# Altium schematic sheet FullAdder_PCB_Project.SchDoc
size A; SheetNumber: 1; SheetTotal: 1
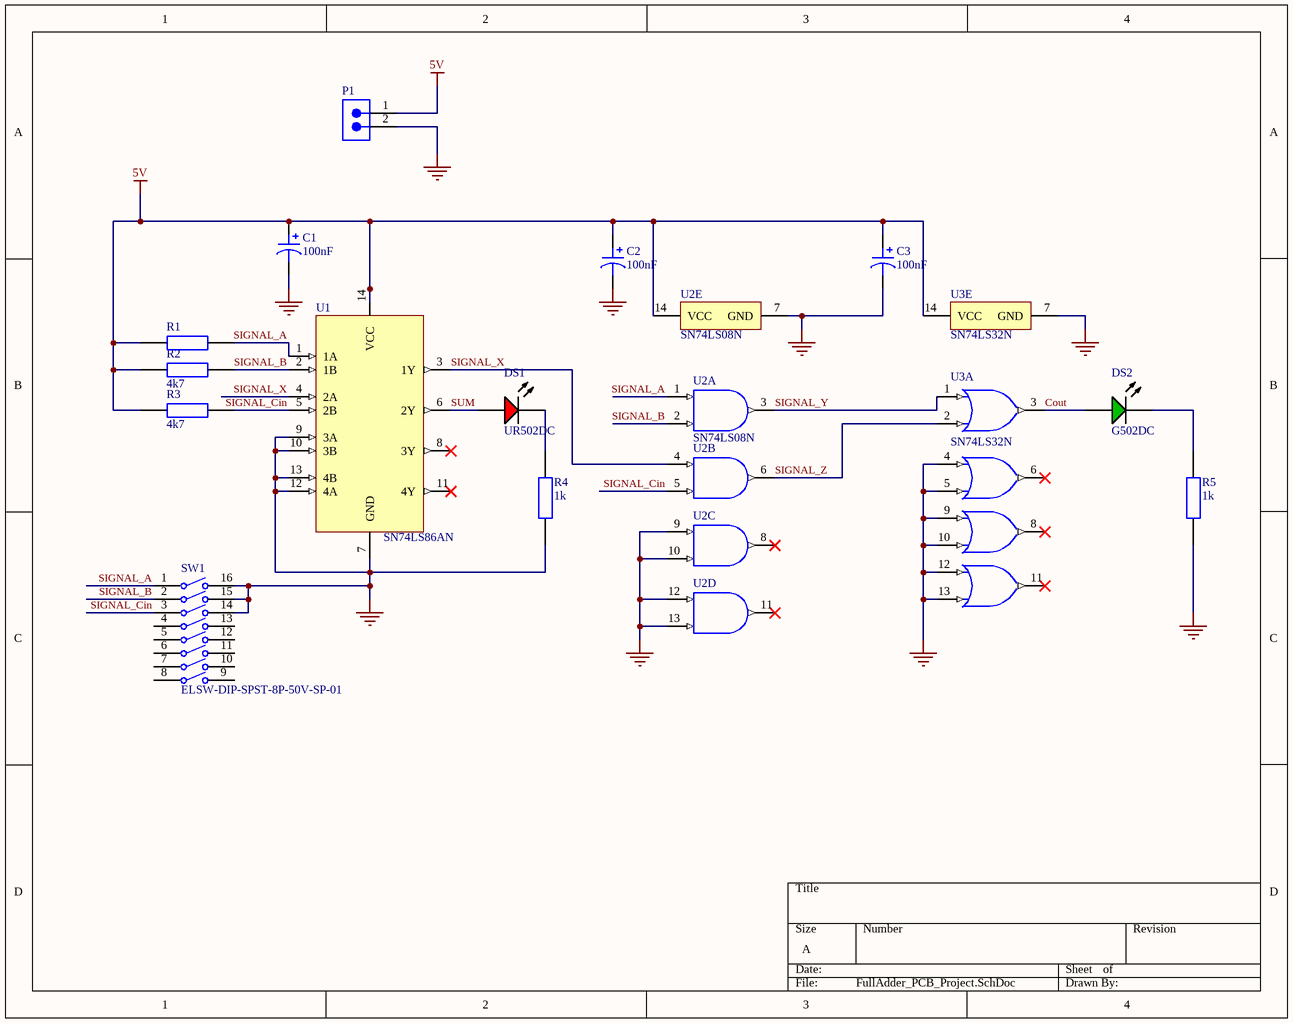
[diagram p0: FullAdder_PCB_Project.SchDoc]

## Parts
C1  value 100nF  [CAP TH ALUM ELEC D4.00mm S1.50mm H6.00mm]  (hidden comment: UMP1H0R1MDD)
C2  value 100nF  [CAP TH ALUM ELEC D4.00mm S1.50mm H6.00mm]  (hidden comment: UMP1H0R1MDD)
C3  value 100nF  [CAP TH ALUM ELEC D4.00mm S1.50mm H6.00mm]  (hidden comment: UMP1H0R1MDD)
DS1  UR502DC  [CGX-UR502DC]
DS2  G502DC  [CGX-G502DC]
P1  TSW-102-26-G-S  [SMTC-TSW-102-26-XX-S]  (value not drawn)
R1  4k7  [RES_AXIAL_L6.3mm_D2.5mm_P10.16mm]  (value not drawn)
R2  4k7  [RES_AXIAL_L6.3mm_D2.5mm_P10.16mm]
R3  4k7  [RES_AXIAL_L6.3mm_D2.5mm_P10.16mm]
R4  1k  [RES_AXIAL_L6.3mm_D2.5mm_P10.16mm]
R5  1k  [RES_AXIAL_L6.3mm_D2.5mm_P10.16mm]
SW1  ELSW-DIP-SPST-8P-50V-SP-01  [DIP_SW_8P_7.62mm_P2.54mm]
U1  SN74LS86AN  [PDIP-14_7.62mm_P2.54mm]
U2  SN74LS08N  [N0014A]  (parts A,B,C,D,E of 5)
U3  SN74LS32N  [N0014A]  (parts A,B,C,D,E of 5)

## Nets
5V: C1.1 C2.1 C3.1 P1.1 R1.1 R2.1 R3.1 U1.14(VCC) U2.14(VCC) U3.14(VCC)
GND: C1.2 C2.2 C3.2 P1.2 R4.1 R5.2 SW1.14 SW1.15 SW1.16 U1.7(GND) U1.9(3A) U1.10(3B) U1.12(4A) U1.13(4B) U2.7(GND) U2.9(3A) U2.10(3B) U2.12(4A) U2.13(4B) U3.4(2A) U3.5(2B) U3.7(GND) U3.9(3A) U3.10(3B) U3.12(4A) U3.13(4B)
Cout: DS2.1(A) U3.3(1Y)
SIGNAL_A: R1.2 SW1.1 U1.1(1A) U2.1(1A)
SIGNAL_B: R2.2 SW1.2 U1.2(1B) U2.2(1B)
SIGNAL_Cin: R3.2 SW1.3 U1.5(2B) U2.5(2B)
SIGNAL_X: U1.3(1Y) U1.4(2A) U2.4(2A)
SIGNAL_Y: U2.3(1Y) U3.1(1A)
SIGNAL_Z: U2.6(2Y) U3.2(1B)
SUM: DS1.1(A) U1.6(2Y)
NetDS1_2: DS1.2(K) R4.2
NetDS2_2: DS2.2(K) R5.1

Not connected (* = marked no-connect by the designer): SW1 4 5 6 7 8 9 10 11 12 13; U1 8(3Y)* 11(4Y)*; U2 8(3Y)* 11(4Y)*; U3 6(2Y)* 8(3Y)* 11(4Y)*

## Library data of the parts
C1-C3 = CMP-001-17277-1: CAP ALUM 0.1UF 20% 50V RADIAL; manufacturer: Nichicon; Polarization: Bi-Polar; Ripple Current @ High Frequency: 1.5mA @ 10kHz; Ripple Current @ Low Frequency: 1mA @ 120Hz; Lifetime @ Temp.: 2000 Hrs @ 85°C; Lifecycle Status: Active; Voltage - Rated: 50V; Lead Spacing: 0.059" (1.50mm); Size / Dimension: 0.157" Dia (4.00mm); Part Status: Active; series: UMP; price: 0.42; Operating Temperature: -40°C ~ 85°C; Part Number: UMP1H0R1MDD; ComponentLink1URL: http://nichicon-us.com/english/products/pdfs/e-ump.pdf; Mounting Type: Through Hole; Height - Seated (Max): 0.236" (6.00mm); ComponentLink1Description: Datasheet; ComponentLink2URL: http://digikey.com/product-detail/en/nichicon/UMP1H0R1MDD/493-15552-ND/2598750; packaging: Bulk; ComponentLink2Description: DigiKey Link; partid: 23220; Applications: General Purpose; Tolerance: 20%; Device Package: Radial, Can; lastupdated: 09/06/2020 1:48:30 AM; Case/Package: Radial, Can; Minimum Order: 1
DS1 = CMP-007-00009-2: Red LED, 80 mW, 30 mA, -25 to 85 degC, 2-Pin THD; Manufacturer: Shenzhen CGX; Power: 80mW; Case/Package: UR502DC; RoHS Compliant: Unknown; Package Description: 2-Pin Through Hole Device, Dia 5.9 mm, Height 9.1 mm; Manufacturer URL: http://szcgx.com/; Datasheet Version: Sep-14; Package Reference: UR502DC; Datasheet URL: http://datasheet.octopart.com/UR502DC-Chengguangxing-datasheet-62330342.pdf; Mounting Technology: TH
DS2 = CMP-007-00008-2: Green LED, 80 mW, 20 mA, -25 to 85 degC, 2-Pin THD; Manufacturer: Shenzhen CGX; Mounting Technology: TH; Package Reference: G502DC; Datasheet Version: Sep-14; Manufacturer URL: http://szcgx.com/; Package Description: 2-Pin Through Hole Device, Dia 5.9 mm; Datasheet URL: http://datasheet.octopart.com/G502DC-Chengguangxing-datasheet-62330340.pdf; Case/Package: G502DC; RoHS Compliant: Unknown
P1 = CMP-1024-00327-1: 0.025" SQ Post Header, Through-hole, Vertical, -55 to 125 degC, 2.54 mm Pitch, 2-Pin, Male, RoHS; Manufacturer: Samtec; Pitch: 2.54 mm; Orientation: Vertical; ComponentLink3Description: Package Specification; PackageReference: TSW-102-26-XX-S; Mounting Technology: Through-hole; ComponentLink2Description: Datasheet; ComponentLink1URL: http://www.samtec.com; DatasheetVersion: F-214; ComponentLink1Description: Manufacturer URL; RoHS: True; ComponentLink2URL: http://www.samtec.com/documents/webfiles/pdf/TSW_TH.PDF; PartNumber: TSW-102-26-G-S; ComponentLink3URL: http://www.samtec.com/documents/webfiles/cpdf/TSW-XXX-XX-XXX-X-XX-XXX-MKT.pdf; PackageDescription: .025[0.64] SQ. Post Terminal Strip Assembly; PackageVersion: DM, 8/1988; Temperature Range: -55 to 125 degC
R1-R5 = Resistor
SW1 = DIP_SW_8P_7.62mm_P2.54mm
U1 = CMP-031-01019-6: 4-ch, 2-input, 4.75-V to 5.25-V bipolar XOR (exclusive OR) gates 14-PDIP 0 to 70; Max Supply Voltage: 5.25V; Min Supply Voltage: 4.75V; Max Operating Temperature: 70°C; Pins: 14; Case/Package: PDIP; Mounting Technology: Through Hole; Min Operating Temperature: 0°C
U2 = CMP-0777-00259-3: Quadruple 2-Input Positive-AND Gates, N0014A, TUBE; Manufacturer: Texas Instruments; VCC(Max)(V): 5.25; ICC @ Nom Voltage(Max)(mA): 0.021; VCC(Min)(V): 4.75; tpd @ Nom Voltage(Max)(ns): 25; Rating: Catalog; Output Type: TTL; Bits(#): 4; Schmitt Trigger: No; Voltage(Nom)(V): 5; Technology Family: LS; F @ Nom Voltage(Max)(Mhz): 35; Output Drive (IOL/IOH)(Max)(mA): -0.8/16; PackageReference: N0014A; DatasheetVersion: SDLS033; Input Type: TTL; Operating Temperature Range(C): 0 to 70; Generic Part Number: SN74LS08
U3 = CMP-1573-00145-3: Quad 2-input positive-OR gates, N0014A, TUBE; Manufacturer: Texas Instruments; tpd @ Nom Voltage(Max)(ns): 22; Output Drive (IOL/IOH)(Max)(mA): 0.8/-16; Input Type: TTL; VCC(Min)(V): 4.75; F @ Nom Voltage(Max)(Mhz): 35; Voltage(Nom)(V): 5; ICC @ Nom Voltage(Max)(mA): 0.038; VCC(Max)(V): 5.25; Rating: Catalog; Bits(#): 4; Generic Part Number: SN74LS32; DatasheetVersion: SDLS100; Operating Temperature Range(C): 0 to 70; Output Type: TTL; Code_JEDEC: MS-001; PackageVersion: http://www.ti.com/lit/ml/mpdi002c/mpdi002c.pdf; PackageReference: N0014A